# Altium project Board1.PrjPcb (part 1 of 2)
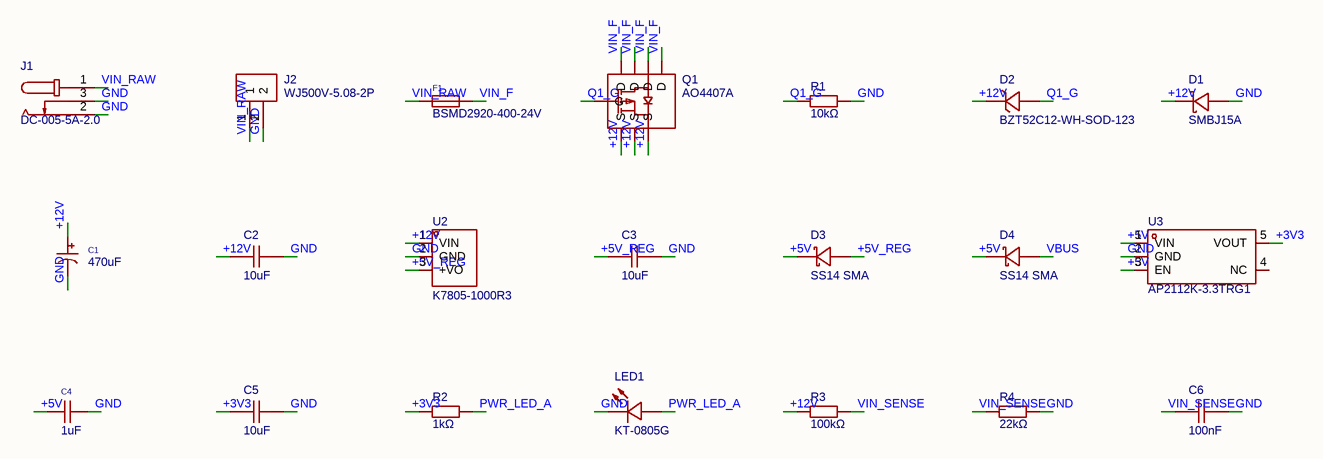
[diagram p0: 1_Power.schdoc]
5 sheets, 106 parts. Net scope: global (net labels, ports and power ports of the same name join across sheets).
Board file: PCB2.PcbDoc
Sheets:
  1_Power.schdoc
  2_MCU.schdoc
  3_Sensors.schdoc
  4_Outputs_A.schdoc
  5_Outputs_B.schdoc

## Sheet 1_Power.schdoc
size 297 x 209 mm; Symbol: Drawing-Symbol_A4; Device: Drawing-Symbol_A4; @Project Name: Irrigation Controller v2; @Page Count: 5; @Update Date: 2026-11-21; @Create Date: 2026-11-21; @Schematic Name: Schematic1; @Page No: 1; @Page Name: 1_Power; Company: EasyEDA.com; Version: V1.0; Page Size: A4; @Create Time: 17:26:39; @Update Time: 17:26:39; Border: 1; Width: 1170; Height: 825; Region Start: 1; X Region Count: 6; Y Region Count: 4; Blade Width: 10; Title Block Position: 3; @Board Name: Board1

### Parts
C1  470uF  [CAP-SMD_BD10.0-L10.3-W10.3-LS11.0-FD]
C2  10uF  [C0805]
C3  10uF  [C0805]
C4  1uF  [C0805]
C5  10uF  [C0805]
C6  100nF  [C0805]
D1  SMBJ15A  [SMB_L4.6-W3.6-LS5.3-RD]
D2  BZT52C12-WH-SOD-123  [SOD-123_L2.7-W1.7-LS3.8-RD]
D3  SS14 SMA  [SMA_L4.3-W2.6-LS5.1-RD]
D4  SS14 SMA  [SMA_L4.3-W2.6-LS5.1-RD]
F1  BSMD2920-400-24V  [F2920]
J1  DC-005-5A-2.0  [DC-IN-TH_DC-005-5A-2.0]
J2  WJ500V-5.08-2P  [CONN-TH_2P-P5.00_WJ500V-5.08-2P]
LED1  KT-0805G  [LED0805-R-RD]
Q1  AO4407A  [SOIC-8_L4.9-W3.9-P1.27-LS6.0-BL]
R1  10kΩ  [R0805]
R2  1kΩ  [R0805]
R3  100kΩ  [R0805]
R4  22kΩ  [R0805]
U2  K7805-1000R3  [PWRM-TH_K78XX-2000]
U3  AP2112K-3.3TRG1  [SOT-25-5_L2.9-W1.6-P0.95-LS2.8-BL]

### Nets
+3V3: C5.1 R2.1 U3.5(VOUT)
+5V: C4.1 D3.1(K) D4.1(K) U3.1(VIN) U3.3(EN)
+5V_REG: C3.1 D3.2(A) U2.3(+VO)
+12V: C1.1 C2.1 D1.1(K) D2.1(K) Q1.1(S) Q1.2(S) Q1.3(S) R3.1 U2.1(VIN)
GND: C1.2 C2.2 C3.2 C4.2 C5.2 C6.2 D1.2(A) J1.2 J1.3 J2.2 LED1.2(K) R1.2 R4.2 U2.2(GND) U3.2(GND)
PWR_LED_A: LED1.1(A) R2.2
Q1_G: D2.2(A) Q1.4(G) R1.1
VBUS: D4.2(A)
VIN_F: F1.2 Q1.5(D) Q1.6(D) Q1.7(D) Q1.8(D)
VIN_RAW: F1.1 J1.1 J2.1
VIN_SENSE: C6.1 R3.2 R4.1

Not connected (* = marked no-connect by the designer): U3 4(NC)

### Notes on the sheet
- Create at
- 2026-11-21
- Schematic
- Board
- Schematic1
- Board1
- Update at
- Page
- 1_Power
- Drawn
- Reviewed
- Irrigation Controller v2
- Version
- V1.0
- Size
- A4
- Page  1  Total  5
- EasyEDA.com

### Library data of the parts
C1 = RVT1E471M1010: Capacitance:470uF Tolerance:±20% Tolerance:±20% Voltage Rating:25V Ripple Current:- Equivalent Series Resistance(ESR):- Diameter:10mm Height - Seated (Max):10.2mm Lifetime:2000hrs@105℃ Operating Temperature:-55℃~+105℃ Operating Temperature:-55℃~+105℃ Pola; Manufacturer: HONOR(荣誉); Symbol: RVT1E471M1010-C3351; Add into BOM: yes; PCB Layer: Default; Tolerance: ±20%; Voltage Rating: 25V; Polarity type: Polarized; ModelId: 44cb92e87a73435bbda93569417358d9|0819f05c4eef4c71ace90d822a990e87; ModelName: CAP-SMD_BD10.0-L10.3-W10.3-H10.2; ModelTransform: 405.511,456.692,0,90,0,0,-0.004,-0.001,0; Device: RVT1E471M1010; Convert to PCB: yes; Manufacturer Part: RVT1E471M1010; Supplier: LCSC; Supplier Part: C3351; Value: 470uF; JLCPCB Part Class: Extended Part; LCSC Part Name: 470uF ±20% 25V; Supplier Footprint: SMD,D10xL10.2mm; Datasheet: https://item.szlcsc.com/datasheet/RVT1E471M1010/3742.html; Ripple Current: -; Equivalent Series Resistance(ESR): -; Diameter: 10mm; Height - Seated (Max): 10.2mm; Lifetime: 2000hrs@105℃; Operating Temperature: -55℃~+105℃; FootprintName: CAP-SMD_BD10.0-L10.3-W10.3-LS11.0-FD
C2 C3 C5 = CL21A106KAYNNNE_C15850: Capacitance:10uF Tolerance:±10% Tolerance:±10% Voltage Rating:25V Temperature Coefficient:X5R; Manufacturer: SAMSUNG(三星); Add into BOM: yes; PCB Layer: Default; Tolerance: ±10%; Voltage Rating: 25V; Temperature Coefficient: X5R; ModelId: 8c88e81f49c6409b980720ec8953afb6|0819f05c4eef4c71ace90d822a990e87; ModelName: C0805_L2.0-W1.3-H1.3; ModelTransform: 78.74,51.181,0,0,0,0,0,0.0005,0; Symbol: CL21A106KAYNNNE; Device: CL21A106KAYNNNE_C15850; Convert to PCB: yes; Manufacturer Part: CL21A106KAYNNNE; Supplier: LCSC; Supplier Part: C15850; LCSC Part Name: 10uF ±10% 25V; Supplier Footprint: 0805; JLCPCB Part Class: Basic Part; Datasheet: https://item.szlcsc.com/datasheet/CL21A106KAYNNNE/16532.html; Value: 10uF; FootprintName: C0805
C4 = CL21B105KBFNNNE: Capacitance:1uF Tolerance:±10% Tolerance:±10% Voltage Rating:50V Temperature Coefficient:X7R; Manufacturer: SAMSUNG(三星); Add into BOM: yes; PCB Layer: Default; Tolerance: ±10%; Voltage Rating: 50V; Temperature Coefficient: X7R; ModelId: 8c88e81f49c6409b980720ec8953afb6|0819f05c4eef4c71ace90d822a990e87; ModelName: C0805_L2.0-W1.3-H1.3; ModelTransform: 78.74,51.181,0,0,0,0,0,0.0005,0; Symbol: CL21B105KBFNNNE; Device: CL21B105KBFNNNE; Convert to PCB: yes; Manufacturer Part: CL21B105KBFNNNE; Supplier: LCSC; Supplier Part: C28323; Value: 1uF; JLCPCB Part Class: Basic Part; LCSC Part Name: 1uF ±10% 50V; Supplier Footprint: 0805; Datasheet: https://item.szlcsc.com/datasheet/CL21B105KBFNNNE/29074.html; FootprintName: C0805
C6 = CC0805KRX7R9BB104: Capacitance:100nF Tolerance:±10% Tolerance:±10% Voltage Rating:50V Temperature Coefficient:X7R; Manufacturer: YAGEO(国巨); Add into BOM: yes; PCB Layer: Default; Tolerance: ±10%; Voltage Rating: 50V; Temperature Coefficient: X7R; ModelId: 8c88e81f49c6409b980720ec8953afb6|0819f05c4eef4c71ace90d822a990e87; ModelName: C0805_L2.0-W1.3-H1.3; ModelTransform: 78.74,51.181,0,0,0,0,0,0.0005,0; Symbol: CC0805KRX7R9BB104; Device: CC0805KRX7R9BB104; Convert to PCB: yes; Manufacturer Part: CC0805KRX7R9BB104; Supplier: LCSC; Supplier Part: C49678; LCSC Part Name: 100nF ±10% 50V; Supplier Footprint: 0805; JLCPCB Part Class: Basic Part; Datasheet: https://item.szlcsc.com/datasheet/CC0805KRX7R9BB104/50686.html; Value: 100nF; FootprintName: C0805
D1 = SMBJ15A: Reverse Stand-Off Voltage (Vrwm):15V Maximum Clamping Voltage:24.4V Peak Pulse Current (Ipp)@10/1000us:24.6A Breakdown Voltage:16.7V; Symbol: SMBJ15A_C232769; Add into BOM: yes; PCB Layer: Default; Reverse Stand-Off Voltage (Vrwm): 15V; Maximum Clamping Voltage: 24.4V; Peak Pulse Current (Ipp)@10/1000us: 24.6A; Breakdown Voltage: 16.7V; ModelId: 6383b9be09eb4825906cf4ce91b85cee|0819f05c4eef4c71ace90d822a990e87; ModelTransform: 212.598,141.732,0,0,0,0,0,0,0; Device: SMBJ15A; Convert to PCB: yes; Manufacturer Part: SMBJ15A; Supplier: LCSC; Supplier Part: C232769; LCSC Part Name: SMBJ15A; Supplier Footprint: SMB(DO-214AA); JLCPCB Part Class: Extended Part; FootprintName: SMB_L4.6-W3.6-LS5.3-RD; ModelName: SMB_L4.6-W3.6-LS5.3-RD
D2 = BZT52C12-WH-SOD-123: Diode Configuration:1 Independent Zener Voltage(Nom):12V Reverse Leakage Current (Ir):100nA@9V Zener Voltage(Range):11.4V~12.7V Zener Voltage(Range):11.4V~12.7V Pd - Power Dissipation:500mW Impedance(Zzt):35Ω Impedance(Zzk):600Ω Operating Junction Tempera; Manufacturer: SY(顺烨); Add into BOM: yes; PCB Layer: Default; Zener Voltage(Nom): 12V; Pd - Power Dissipation: 500mW; Impedance(Zzt): 35Ω; Impedance(Zzk): 600Ω; Operating Junction Temperature Range: -55℃~+150℃; ModelId: 619603fa8f4b456cbd6047d9f8e47121|0819f05c4eef4c71ace90d822a990e87; ModelTransform: 145.669,64.961,0,0,0,0,0,0,0; Symbol: BZT52C12-WH-SOD-123; Device: BZT52C12-WH-SOD-123; Convert to PCB: yes; Manufacturer Part: BZT52C12-WH-SOD-123; Supplier: LCSC; Supplier Part: C5464725; LCSC Part Name: 独立式 耐压:12V 电流:0.1uA@9V; Supplier Footprint: SOD-123; JLCPCB Part Class: Extended Part; Datasheet: https://item.szlcsc.com/datasheet/BZT52C12-WH-SOD-123/6380071.html; Diode Configuration: 1 Independent; Reverse Leakage Current (Ir): 100nA@9V; Zener Voltage(Range): 11.4V~12.7V; Tolerance: -; FootprintName: SOD-123_L2.7-W1.7-LS3.8-RD; ModelName: SOD-123_L2.7-W1.7-LS3.8-RD
D3 D4 = SS14 SMA: Diode Configuration:1 Independent Voltage - Forward(Vf@If):550mV@1A Voltage - DC Reverse(Vr):40V Current - Rectified:1A Reverse Leakage Current (Ir):500uA@40V Operating Junction Temperature Range:-65℃~+125℃ Operating Junction Temperature Range:-65℃~+125℃; Manufacturer: Yint(音特电子); Add into BOM: yes; PCB Layer: Default; Voltage - DC Reverse(Vr): 40V; Current - Rectified: 1A; Non-Repetitive Peak Forward Surge Current: 40A; ModelId: 9f0f28a3f5e244ceb50a0213b7a9858d|0819f05c4eef4c71ace90d822a990e87; ModelTransform: 196.4563,102.362,0,0,0,0,0.001,-0.001,0; Symbol: SS14 SMA; Device: SS14 SMA; Convert to PCB: yes; Manufacturer Part: SS14 SMA; Supplier: LCSC; Supplier Part: C2920036; LCSC Part Name: 电压:40V 电流:1A; Supplier Footprint: SMA(DO-214AC); JLCPCB Part Class: Extended Part; Datasheet: https://item.szlcsc.com/datasheet/SS14%2520SMA/3223905.html; Diode Configuration: 1 Independent; Voltage - Forward(Vf@If): 550mV@1A; Reverse Leakage Current (Ir): 500uA@40V; Operating Junction Temperature Range: -65℃~+125℃; FootprintName: SMA_L4.3-W2.6-LS5.1-RD; ModelName: SMA_L4.3-W2.6-LS5.1-RD
F1 = BSMD2920-400-24V: Voltage - Max:24V Current - Max:40A Hold Current:4A Trip Current:8A Power Dissipation:2W Resistance - Initial (Ri) (Min):8mΩ Resistance - Post Trip (R1) (Max):40mΩ Time to Trip(Max):4s Operating Temperature:-40℃~+85℃ Operating Temperature:-40℃~+85℃ Length; Manufacturer: BHFUSE(佰宏); Add into BOM: yes; PCB Layer: Default; Voltage - Max: 24V; Current - Max: 40A; Hold Current: 4A; Trip Current: 8A; Power Dissipation: 2W; Resistance - Initial (Ri) (Min): 8mΩ; Resistance - Post Trip (R1) (Max): 40mΩ; Time to Trip(Max): 4s; ModelId: c20979b6eed84fe694c25fdbe1326c05|0819f05c4eef4c71ace90d822a990e87; ModelName: F2920-1; ModelTransform: 289.7632,201.5744,0,0,0,0,0,0,0; Symbol: BSMD2920-400-24V; Device: BSMD2920-400-24V; Convert to PCB: yes; Manufacturer Part: BSMD2920-400-24V; Supplier: LCSC; Supplier Part: C960036; JLCPCB Part Class: Extended Part; LCSC Part Name: 24V 4A 2920自恢复; Supplier Footprint: 2920; Datasheet: https://item.szlcsc.com/datasheet/BSMD2920-400-24V/1039136.html; Operating Temperature: -40℃~+85℃; Length: 7.98mm; Width: 5.44mm; Height: 1.6mm; Pitch: -; FootprintName: F2920
J1 = DC-005-5A-2.0: Connector Type:DC Power Jack Mounting Type:Right Angle Inside Contact Diameter:2mm Outside Contact Diameter:6.2mm Current Rating:5A Voltage Rating (Max):24V Body Height:11mm Length:14mm Width:9mm Operating Temperature:-20℃~+70℃ Operating Temperature:-20℃~; Manufacturer: XKB Connection(中国星坤); Add into BOM: yes; PCB Layer: Default; Inside Contact Diameter: 2mm; Outside Contact Diameter: 6.2mm; Current Rating: 5A; Voltage Rating (Max): 24V; Body Height: 11mm; ModelId: 141bb14832c5420aa468d11a1b22105a|0819f05c4eef4c71ace90d822a990e87; ModelName: DC-IN-TH_L14.4-W9.0-H11.0; ModelTransform: 366.141,566.928,0,270,0,0,-143.701,86.614,-157.48; Symbol: DC-005-5A-2.0; Device: DC-005-5A-2.0; Convert to PCB: yes; Manufacturer Part: DC-005-5A-2.0; Supplier: LCSC; Supplier Part: C381116; LCSC Part Name: DC电源插座 内径:2mm 外径:6.2mm; Supplier Footprint: 插件; JLCPCB Part Class: Extended Part; Datasheet: https://item.szlcsc.com/datasheet/DC-005-5A-2.0/353348.html; Connector Type: DC Power Jack; Mounting Type: Right Angle; Length: 14mm; Width: 9mm; Operating Temperature: -20℃~+70℃; FootprintName: DC-IN-TH_DC-005-5A-2.0
J2 = WJ500V-5.08-2P: Number of Positions or Pins:1x2P Pitch:5.08mm Color:Green Mounting Type:Through Hole Number of Pins:2P Number of Rows:1 Number of PINs Per Row:2 Screw Specification:M2.5 Current Rating:18A Voltage Rating (Max):250V Wire Gauge - AWG:14~30 Wire Gauge - mm2:; Manufacturer: KANGNEX(康奈克斯电气); Symbol: WJ500V-5.08-2P-14-00A; Add into BOM: yes; PCB Layer: Default; Number of Positions or Pins: 1x2P; Pitch: 5.08mm; Number of PINs Per Row: 2; Screw Specification: M2.5; Current Rating: 18A; Voltage Rating (Max): 250V; Wire Gauge - AWG: 14~30; Wire Gauge - mm2: 2.5; ModelId: 2bff34d19d2f4f9cb7f6a8b7d3be06fd|0819f05c4eef4c71ace90d822a990e87; ModelTransform: 423.621,393.7,0,0,0,0,-11.811,19.685,-137.795; Device: WJ500V-5.08-2P; Convert to PCB: yes; Manufacturer Part: WJ500V-5.08-2P; Supplier: LCSC; Supplier Part: C8465; LCSC Part Name: 1x2P 5.08mm 直插 排数:1 每排P数:2; Supplier Footprint: 插件,P=5.08mm; JLCPCB Part Class: Extended Part; Datasheet: https://item.szlcsc.com/datasheet/WJ500V-5.08-2P/8959.html; Color: Green; Mounting Type: Through Hole; Number of Pins: 2P; Number of Rows: 1; Operating Temperature: -40℃~+105℃; Height Above Board: 14.07mm; FootprintName: CONN-TH_2P-P5.00_WJ500V-5.08-2P; ModelName: CONN-TH_2P-P5.00_WJ500V-5.08-2P
LED1 = KT-0805G: Lamp Holder Type:2mm x 1.25mm square LED Illumination Color:Emerald Green Voltage - Forward(Vf):2.6V~3.1V Voltage - Forward(Vf):2.6V~3.1V Power(Watts):100mW Forward Current:5mA Wavelength - Dominant:513nm~528nm Wavelength - Dominant:513nm~528nm Peak Wavel; Manufacturer: KENTO; Symbol: 0805G (Green); Add into BOM: yes; PCB Layer: Default; Power(Watts): 100mW; Forward Current: 5mA; Peak Wavelength: 525nm; Diode Configuration: Discrete Diode; Lens Color: Water Clear; Luminous Intensity: 430mcd; Viewing Angle: 120°; ModelId: 167045bb0eae412b9d5564860e113a91|0819f05c4eef4c71ace90d822a990e87; ModelName: LED0805-RD; ModelTransform: 79.527,49.2125,0,0,0,0,0,0,0; Device: KT-0805G; Convert to PCB: yes; Manufacturer Part: KT-0805G; Supplier: LCSC; Supplier Part: C2297; LCSC Part Name: 0805 翠绿 高亮; Supplier Footprint: 0805; JLCPCB Part Class: Basic Part; Datasheet: https://item.szlcsc.com/datasheet/KT-0805G/2670.html; Lamp Holder Type: 2mm x 1.25mm square LED; Illumination Color: Emerald Green; Voltage - Forward(Vf): 2.6V~3.1V; Wavelength - Dominant: 513nm~528nm; Color Temperature: -; Mounting Style: -; Operating Temperature: -40℃~+85℃; FootprintName: LED0805-R-RD
Q1 = AO4407A_C16072: Number:1 P-Channel Drain to Source Voltage:30V Current - Continuous Drain(Id):12A RDS(on):38mΩ@5V Pd - Power Dissipation:3.1W Gate Threshold Voltage (Vgs(th)):3V Gate Charge(Qg):39nC@10V Input Capacitance(Ciss):2.6nF Reverse Transfer Capacitance (Crss@Vds; Manufacturer: AOS; Add into BOM: yes; PCB Layer: Default; Drain to Source Voltage: 30V; Current - Continuous Drain(Id): 12A; Pd - Power Dissipation: 3.1W; Gate Threshold Voltage (Vgs(th)): 3V; Input Capacitance(Ciss): 2.6nF; Reverse Transfer Capacitance (Crss@Vds): 295pF; Output Capacitance(Coss): 370pF; Vgs: ±25V; ModelId: 2ec1ac1bf9bf4d09a988fcee15e6a02d|0819f05c4eef4c71ace90d822a990e87; ModelName: SOIC-8_L4.9-W3.9-H1.7-LS6.0-P1.27; ModelTransform: 192.913,236.22,0,0,0,0,0,0,0; Symbol: AO4407A; Device: AO4407A_C16072; Convert to PCB: yes; Manufacturer Part: AO4407A; Supplier: LCSC; Supplier Part: C16072; LCSC Part Name: 1个P沟道 耐压:30V 电流:12A; Supplier Footprint: SOIC-8; JLCPCB Part Class: Extended Part; Datasheet: https://item.szlcsc.com/datasheet/AO4407A/16754.html; Number: 1 P-Channel; RDS(on): 38mΩ@5V; Gate Charge(Qg): 39nC@10V; Operating Temperature: -; Configuration: -; Type: P-Channel; FootprintName: SOIC-8_L4.9-W3.9-P1.27-LS6.0-BL
R1 = 0805W8F1002T5E: Type:Thick Film Resistor Resistance:10kΩ Tolerance:±1% Tolerance:±1% Power(Watts):125mW Voltage-Supply(Max):150V Temperature Coefficient:±100ppm/℃ Temperature Coefficient:±100ppm/℃ Operating Temperature:-55℃~+155℃ Operating Temperature:-55℃~+155℃; Manufacturer: UNI-ROYAL(厚声); Add into BOM: yes; PCB Layer: Default; Tolerance: ±1%; Power(Watts): 125mW; Voltage-Supply(Max): 150V; ModelId: b83c7c5430874b8eb2319a65d9433429|0819f05c4eef4c71ace90d822a990e87; ModelName: R0805_L2.0-W1.3-H0.6; ModelTransform: 78.74,51.181,0,0,0,0,0,-0.0005,0; Symbol: 0805W8F1002T5E; Device: 0805W8F1002T5E; Convert to PCB: yes; Manufacturer Part: 0805W8F1002T5E; Supplier: LCSC; Supplier Part: C17414; LCSC Part Name: 厚膜电阻 10kΩ ±1%; Supplier Footprint: 0805; JLCPCB Part Class: Basic Part; Datasheet: https://item.szlcsc.com/datasheet/0805W8F1002T5E/18102.html; Type: Thick Film Resistor; Value: 10kΩ; Temperature Coefficient: ±100ppm/℃; Operating Temperature: -55℃~+155℃; FootprintName: R0805
R2 = 0805W8F1001T5E: Type:Thick Film Resistors Resistance:1kΩ Tolerance:±1% Tolerance:±1% Power(Watts): Overload Voltage (Max): Temperature Coefficient:±100ppm/℃ Temperature Coefficient:±100ppm/℃ Operating Temperature Range:-55℃~+155℃ Operating Temperature Range:-55℃~+155℃; Manufacturer: UNI-ROYAL(厚声); Add into BOM: yes; PCB Layer: Default; Tolerance: ±1%; ModelId: b83c7c5430874b8eb2319a65d9433429|0819f05c4eef4c71ace90d822a990e87; ModelName: R0805_L2.0-W1.3-H0.6; ModelTransform: 78.74,51.181,0,0,0,0,0,-0.0005,0; Symbol: 0805W8F1001T5E; Device: 0805W8F1001T5E; Convert to PCB: yes; Manufacturer Part: 0805W8F1001T5E; Supplier: LCSC; Supplier Part: C17513; LCSC Part Name: 1kΩ ±1% 125mW 厚膜电阻; Supplier Footprint: 0805; JLCPCB Part Class: Basic Part; Datasheet: https://atta.szlcsc.com/upload/public/pdf/source/20200306/C422600_1E6D84923E4A46A82E41ADD87F860B5C.pdf; Type: Thick Film Resistors; Value: 1kΩ; Temperature Coefficient: ±100ppm/℃; Operating Temperature Range: -55℃~+155℃; FootprintName: R0805
R3 = 0805W8F1003T5E (SMT业务专用): Type: Resistance: Tolerance:±1% Tolerance:±1% Power(Watts):- Overload Voltage (Max):-; Manufacturer: UNI-ROYAL(厚声); Add into BOM: yes; PCB Layer: Default; Tolerance: ±1%; ModelId: b83c7c5430874b8eb2319a65d9433429|0819f05c4eef4c71ace90d822a990e87; ModelName: R0805_L2.0-W1.3-H0.6; ModelTransform: 78.74,51.181,0,0,0,0,0,-0.0005,0; Symbol: 0805W8F1003T5E; Device: 0805W8F1003T5E (SMT业务专用); Convert to PCB: yes; Manufacturer Part: 0805W8F1003T5E (SMT业务专用); Supplier: LCSC; Supplier Part: C17407; LCSC Part Name: 100kΩ ±1%; Supplier Footprint: 0805; JLCPCB Part Class: Extended Part; Datasheet: https://atta.szlcsc.com/upload/public/pdf/source/20200102/C423413_58AC64FF5730584578C10BF0002471B1.pdf; Value: 100kΩ; Power(Watts): -; Overload Voltage (Max): -; FootprintName: R0805
R4 = 0805W8F2202T5E: Type:Thick Film Resistor Resistance:22kΩ Tolerance:±1% Tolerance:±1% Power(Watts):125mW Voltage-Supply(Max):150V Temperature Coefficient:±100ppm/℃ Temperature Coefficient:±100ppm/℃ Operating Temperature:-55℃~+155℃ Operating Temperature:-55℃~+155℃; Manufacturer: UNI-ROYAL(厚声); Add into BOM: yes; PCB Layer: Default; Tolerance: ±1%; Power(Watts): 125mW; Voltage-Supply(Max): 150V; ModelId: b83c7c5430874b8eb2319a65d9433429|0819f05c4eef4c71ace90d822a990e87; ModelName: R0805_L2.0-W1.3-H0.6; ModelTransform: 78.74,51.181,0,0,0,0,0,-0.0005,0; Symbol: 0805W8F2202T5E; Device: 0805W8F2202T5E; Convert to PCB: yes; Manufacturer Part: 0805W8F2202T5E; Supplier: LCSC; Supplier Part: C17560; LCSC Part Name: 厚膜电阻 22kΩ ±1%; Supplier Footprint: 0805; JLCPCB Part Class: Basic Part; Datasheet: https://item.szlcsc.com/datasheet/0805W8F2202T5E/18248.html; Type: Thick Film Resistor; Value: 22kΩ; Temperature Coefficient: ±100ppm/℃; Operating Temperature: -55℃~+155℃; FootprintName: R0805
U2 = K7805-1000R3_C111280: Type:- Function:- Number of Outputs:1 Voltage - Supply:8V~36V Voltage - Supply:8V~36V Conversion Efficiency:86%；93% Conversion Efficiency:86%；93% Output Voltage:-5V；5V Output Voltage:-5V；5V Output Voltage Accuracy:±3% Output Voltage Accuracy:±3% Output Cu; Manufacturer: MORNSUN(金升阳); Add into BOM: yes; PCB Layer: Default; Number of Outputs: 1; Voltage - Supply: 8V~36V; Output Voltage: -5V；5V; Output Voltage Accuracy: ±3%; Output Current(Max): 1A；-500mA; Quiescent Supply Current: 100uA; Ripple Noise: 75mVp-p; Switching Frequency: 520kHz; Capacitive Load(Max): 680uF；330uF; ModelId: 655201e880d449c5a288a7368650974c|0819f05c4eef4c71ace90d822a990e87; ModelName: PWRM-TH_L11.5-W9.0-H17.5-P2.54; ModelTransform: 452.755,354.33,0,0,0,0,0.512,-92.48,-137.795; Symbol: K7805-1000R3; Device: K7805-1000R3_C111280; Convert to PCB: yes; Manufacturer Part: K7805-1000R3; Supplier: LCSC; Supplier Part: C111280; LCSC Part Name: DC/DC模块电源，宽电压输入，非隔离稳压单路输出; Supplier Footprint: SIP,11.5x9mm; JLCPCB Part Class: Extended Part; Datasheet: https://item.szlcsc.com/datasheet/K7805-1000R3/112506.html; Type: -; Function: -; Conversion Efficiency: 86%；93%; Operating Temperature Range: -40℃~+85℃; Length: 11.5mm; Width: 9mm; Height: 17.5mm; Features: Short Circuit Protection；Automatic fault recovery; FootprintName: PWRM-TH_K78XX-2000
U3 = AP2112K-3.3TRG1: Output Configuration:Positive Voltage - Supply:6V Output Voltage:3.3V Output Voltage:3.3V Output Current:600mA Power Supply Rejection Ratio (PSRR):65dB@(1kHz) Voltage Dropout:250mV@(600mA) standby current:55uA Noise:50uVrms Features:Enable control；Short C; Manufacturer: DIODES(美台); Add into BOM: yes; PCB Layer: Default; Voltage - Supply: 6V; Output Voltage: 3.3V; standby current: 55uA; Output Type: Fixed; Number of Outputs: 1; ModelId: 6177bbcd6fc94df4b4ba2f22405723a0|0819f05c4eef4c71ace90d822a990e87; ModelTransform: 114.173,110.236,0,0,0,0,0,0,0; Symbol: AP2112K-3.3TRG1; Device: AP2112K-3.3TRG1; Convert to PCB: yes; Manufacturer Part: AP2112K-3.3TRG1; Supplier: LCSC; Supplier Part: C51118; LCSC Part Name: 3.3V 600mA 6V; Supplier Footprint: SOT-25-5; JLCPCB Part Class: Extended Part; Datasheet: https://item.szlcsc.com/datasheet/AP2112K-3.3TRG1/52131.html; Output Configuration: Positive; Output Current: 600mA; Power Supply Rejection Ratio (PSRR): 65dB@(1kHz); Voltage Dropout: 250mV@(600mA); Noise: 50uVrms; Features: Enable control；Short Circuit Protection；Output discharge；Over Current Protection；Thermal shutdown; Operating Temperature: -40℃~+85℃@(Ta); FootprintName: SOT-25-5_L2.9-W1.6-P0.95-LS2.8-BL; ModelName: SOT-25-5_L2.9-W1.6-P0.95-LS2.8-BL

## Sheet 2_MCU.schdoc
size 297 x 209 mm; Symbol: Drawing-Symbol_A4; Device: Drawing-Symbol_A4; @Project Name: Irrigation Controller v2; @Page Count: 5; @Update Date: 2026-11-21; @Create Date: 2026-11-21; @Schematic Name: Schematic1; @Page No: 2; @Page Name: 2_MCU; Company: EasyEDA.com; Version: V1.0; Page Size: A4; @Create Time: 17:28:43; @Update Time: 17:28:43; Border: 1; Width: 1170; Height: 825; Region Start: 1; X Region Count: 6; Y Region Count: 4; Blade Width: 10; Title Block Position: 3; @Board Name: Board1
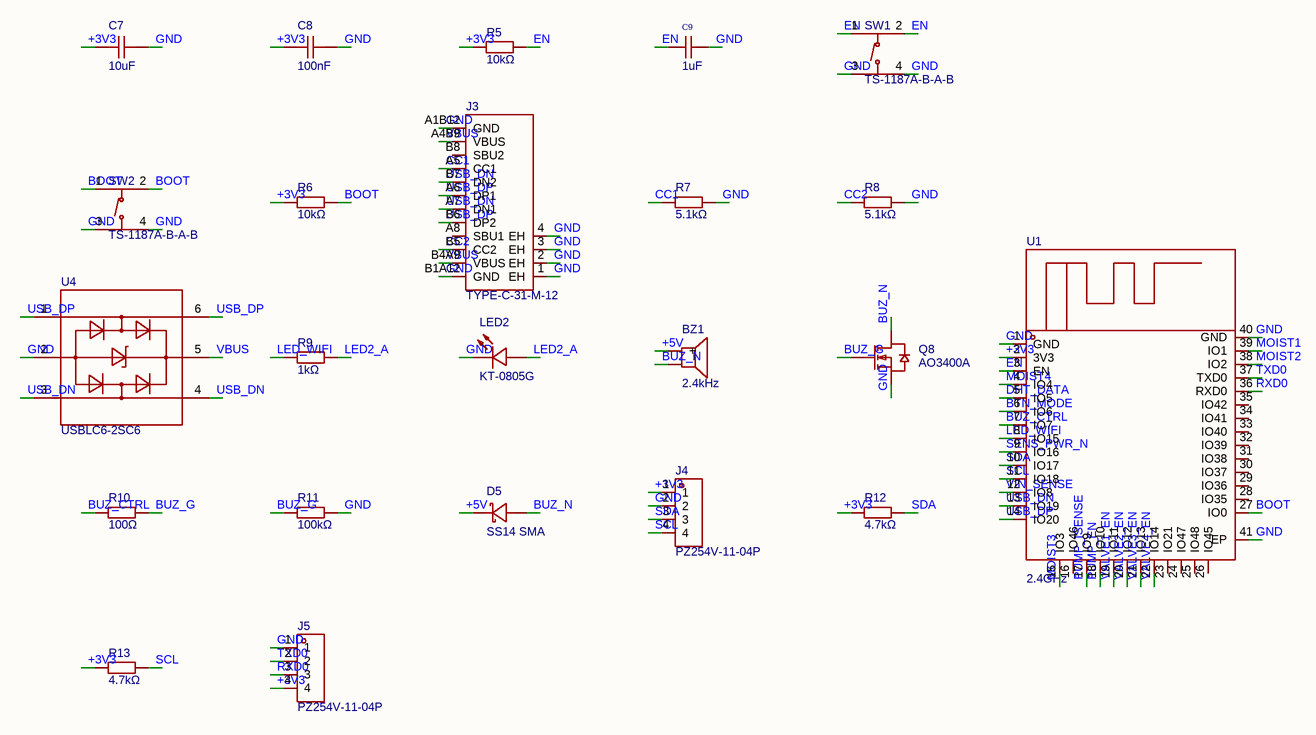
[diagram p1: 2_MCU.schdoc]

### Parts
BZ1  2.4kHz  [BUZ-TH_BD12.0-P7.60-D0.6-FD]
C7  10uF  [C0805]
C8  100nF  [C0805]
C9  1uF  [C0805]
D5  SS14 SMA  [SMA_L4.3-W2.6-LS5.1-RD]
J3  TYPE-C-31-M-12  [USB-C_SMD-TYPE-C-31-M-12_1]
J4  PZ254V-11-04P  [HDR-TH_4P-P2.54-V-M]
J5  PZ254V-11-04P  [HDR-TH_4P-P2.54-V-M]
LED2  KT-0805G  [LED0805-R-RD]
Q8  AO3400A  [SOT-23-3_L2.9-W1.3-P1.90-LS2.4-BR]
R5  10kΩ  [R0805]
R6  10kΩ  [R0805]
R7  5.1kΩ  [R0805]
R8  5.1kΩ  [R0805]
R9  1kΩ  [R0805]
R10  100Ω  [R0805]
R11  100kΩ  [R0805]
R12  4.7kΩ  [R0805]
R13  4.7kΩ  [R0805]
SW1  TS-1187A-B-A-B  [SW-SMD_4P-L5.1-W5.1-P3.70-LS6.5-TL_H1.5]
SW2  TS-1187A-B-A-B  [SW-SMD_4P-L5.1-W5.1-P3.70-LS6.5-TL_H1.5]
U1  2.4GHz  [WIFIM-SMD_ESP32-S3-WROOM-1-N8]
U4  USBLC6-2SC6  [SOT-23-6_L2.9-W1.6-P0.95-LS2.8-BL]

### Nets
+3V3: C7.1 C8.1 J4.1 J5.4 R5.1 R6.1 R12.1 R13.1 U1.2(3V3)
+5V: BZ1.1(+) D5.1(K)
BOOT: R6.2 SW2.1(A) SW2.2(B) U1.27(IO0)
BTN_MODE: U1.6(IO6)
BUZ_CTRL: R10.1 U1.7(IO7)
BUZ_G: Q8.1(G) R10.2 R11.1
BUZ_N: BZ1.2 D5.2(A) Q8.3(D)
CC1: J3.A5(CC1) R7.1
CC2: J3.B5(CC2) R8.1
DHT_DATA: U1.5(IO5)
EN: C9.1 R5.2 SW1.1(A) SW1.2(B) U1.3(EN)
GND: C7.2 C8.2 C9.2 J3.1(EH) J3.2(EH) J3.3(EH) J3.4(EH) J3.A1B12(GND) J3.B1A12(GND) J4.2 J5.1 LED2.2(K) Q8.2(S) R7.2 R8.2 R11.2 SW1.3(C) SW1.4(D) SW2.3(C) SW2.4(D) U1.1(GND) U1.40(GND) U1.41(EP) U4.2
LED2_A: LED2.1(A) R9.2
LED_WIFI: R9.1 U1.8(IO15)
MOIST1: U1.39(IO1)
MOIST2: U1.38(IO2)
MOIST3: U1.15(IO3)
MOIST4: U1.4(IO4)
PUMP_EN: U1.18(IO10)
PUMP_ISENSE: U1.17(IO9)
RXD0: J5.3 U1.36(RXD0)
SCL: J4.4 R13.2 U1.11(IO18)
SDA: J4.3 R12.2 U1.10(IO17)
SENS_PWR_N: U1.9(IO16)
TXD0: J5.2 U1.37(TXD0)
USB_DN: J3.A7(DN1) J3.B7(DN2) U1.13(IO19) U4.3 U4.4
USB_DP: J3.A6(DP1) J3.B6(DP2) U1.14(IO20) U4.1 U4.6
VALVE1_EN: U1.19(IO11)
VALVE2_EN: U1.20(IO12)
VALVE3_EN: U1.21(IO13)
VALVE4_EN: U1.22(IO14)
VBUS: J3.A4B9(VBUS) J3.B4A9(VBUS) U4.5
VIN_SENSE: U1.12(IO8)

Not connected (* = marked no-connect by the designer): J3 A8(SBU1) B8(SBU2); U1 16(IO46) 23(IO21) 24(IO47) 25(IO48) 26(IO45) 28(IO35) 29(IO36) 30(IO37) 31(IO38) 32(IO39) 33(IO40) 34(IO41) 35(IO42)

### Notes on the sheet
- Create at
- 2026-11-21
- Schematic
- Board
- Schematic1
- Board1
- Update at
- Page
- 2_MCU
- Drawn
- Reviewed
- Irrigation Controller v2
- Version
- V1.0
- Size
- A4
- Page  2  Total  5
- EasyEDA.com

### Library data of the parts
BZ1 = TMB12A05: Driver Circuitry:Active Buzzer (Built-in Driving Circuit) Technology:Electromagnetic Voltage Rating:5V Voltage - Supply:4V~8V Voltage - Supply:4V~8V Frequency:2.4kHz Current Consumption:30mA Sound Pressure Level(SPL):85dB Diameter(φD):12mm Length:- Width:; Manufacturer: 华能; Add into BOM: yes; PCB Layer: Default; Voltage Rating: 5V; Voltage - Supply: 4V~8V; Current Consumption: 30mA; Sound Pressure Level(SPL): 85dB; ModelId: 309f522c52df4298a8617da4d1b9f47c|0819f05c4eef4c71ace90d822a990e87; ModelName: BUZ-TH_D12.0-H9.5-P7.60; ModelTransform: 472.44,472.176,0,90,0,0,-0.787,0,-177.165; Symbol: TMB12A05; Device: TMB12A05; Convert to PCB: yes; Manufacturer Part: TMB12A05; Supplier: LCSC; Supplier Part: C96093; LCSC Part Name: 有源(内含驱动线路) 电磁式 2.4kHz; Supplier Footprint: 插件,D=12mm; JLCPCB Part Class: Extended Part; Datasheet: https://item.szlcsc.com/datasheet/TMB12A05/97297.html; Driver Circuitry: Active Buzzer (Built-in Driving Circuit); Technology: Electromagnetic; Value: 2.4kHz; Diameter(φD): 12mm; Length: -; Width: -; Height: 9.8mm; Operating Temperature: -40℃~+85℃; Mounting Type: Through-hole; Lead Pitch: -; Continuous Operating Time: -; FootprintName: BUZ-TH_BD12.0-P7.60-D0.6-FD
C7 = CL21A106KAYNNNE_C15850: as C2 on sheet 1_Power; Symbol: CL21A106KAYNNNE; Device: CL21A106KAYNNNE_C15850; Convert to PCB: yes; Manufacturer Part: CL21A106KAYNNNE; Supplier: LCSC; Supplier Part: C15850; LCSC Part Name: 10uF ±10% 25V; Supplier Footprint: 0805; JLCPCB Part Class: Basic Part; Datasheet: https://item.szlcsc.com/datasheet/CL21A106KAYNNNE/16532.html; Value: 10uF; FootprintName: C0805
C8 = CC0805KRX7R9BB104: as C6 on sheet 1_Power; Symbol: CC0805KRX7R9BB104; Device: CC0805KRX7R9BB104; Convert to PCB: yes; Manufacturer Part: CC0805KRX7R9BB104; Supplier: LCSC; Supplier Part: C49678; LCSC Part Name: 100nF ±10% 50V; Supplier Footprint: 0805; JLCPCB Part Class: Basic Part; Datasheet: https://item.szlcsc.com/datasheet/CC0805KRX7R9BB104/50686.html; Value: 100nF; FootprintName: C0805
C9 = CL21B105KBFNNNE: as C4 on sheet 1_Power; Symbol: CL21B105KBFNNNE; Device: CL21B105KBFNNNE; Convert to PCB: yes; Manufacturer Part: CL21B105KBFNNNE; Supplier: LCSC; Supplier Part: C28323; Value: 1uF; JLCPCB Part Class: Basic Part; LCSC Part Name: 1uF ±10% 50V; Supplier Footprint: 0805; Datasheet: https://item.szlcsc.com/datasheet/CL21B105KBFNNNE/29074.html; FootprintName: C0805
D5 = SS14 SMA: as D3 on sheet 1_Power; Symbol: SS14 SMA; Device: SS14 SMA; Convert to PCB: yes; Manufacturer Part: SS14 SMA; Supplier: LCSC; Supplier Part: C2920036; LCSC Part Name: 电压:40V 电流:1A; Supplier Footprint: SMA(DO-214AC); JLCPCB Part Class: Extended Part; Datasheet: https://item.szlcsc.com/datasheet/SS14%2520SMA/3223905.html; Diode Configuration: 1 Independent; Voltage - Forward(Vf@If): 550mV@1A; Reverse Leakage Current (Ir): 500uA@40V; Operating Junction Temperature Range: -65℃~+125℃; FootprintName: SMA_L4.3-W2.6-LS5.1-RD; ModelName: SMA_L4.3-W2.6-LS5.1-RD
J3 = TYPE-C-31-M-12: Connector Type:Type-C Protocol Standard:- Gender:Female Mounting Type:Surface Mount, Right Angle Number of Contacts:16P Number of Ports:1 Current Rating-Power:5A Voltage Rating:20V Connect-Disconnect Life:10,000 cycles Length:7.35mm Operating Temperature:; Manufacturer: 韩国韩荣; Add into BOM: yes; PCB Layer: Default; Connector Type: Type-C; Gender: Female; Number of Contacts: 16P; Number of Ports: 1; Current Rating-Power: 5A; Voltage Rating: 20V; ModelId: 8421221a464047838322348b3a9debc3|0819f05c4eef4c71ace90d822a990e87; ModelTransform: 351.9678,311.023,0,180,0,0,0,-43.307,-33.465; Symbol: TYPE-C-31-M-12; Device: TYPE-C-31-M-12; Convert to PCB: yes; Manufacturer Part: TYPE-C-31-M-12; Supplier: LCSC; Supplier Part: C165948; LCSC Part Name: Type-C 母 卧贴; Supplier Footprint: SMD; JLCPCB Part Class: Extended Part; Datasheet: https://item.szlcsc.com/datasheet/TYPE-C-31-M-12/177331.html; Protocol Standard: -; Mounting Type: Surface Mount, Right Angle; Connect-Disconnect Life: 10,000 cycles; Length: 7.35mm; Operating Temperature: -30℃~+80℃; FootprintName: USB-C_SMD-TYPE-C-31-M-12_1; ModelName: USB-C_SMD-TYPE-C-31-M-12_1
J4 J5 = PZ254V-11-04P_C492403: Pin Structure:1x4P Pitch:2.54mm Row Spacing:- Circluar Pins/Square Pins:Square pin Mounting Type:Through Hole Number of Rows:1 Number of Pins:4P Current Rating:3A Voltage Rating (Max):250V Length of Mating Pin:6.1mm Insulation Height:2.5mm Length of End C; Manufacturer: XFCN(兴飞); Add into BOM: yes; PCB Layer: Default; Pin Structure: 1x4P; Pitch: 2.54mm; Current Rating: 3A; Voltage Rating (Max): 250V; ModelId: 69e0934d9b9245f6ab499bc5a319b3aa|0819f05c4eef4c71ace90d822a990e87; ModelName: HDR-TH_4P-P2.54-M-LI-1X4P; ModelTransform: 399.999,104.7242,0,0,0,0,0,0,-118.11; Symbol: PZ254V-11-04P; Device: PZ254V-11-04P_C492403; Convert to PCB: yes; Manufacturer Part: PZ254V-11-04P; Supplier: LCSC; Supplier Part: C492403; LCSC Part Name: 1x4P 间距:2.54mm 方针 直插; Supplier Footprint: 插件,P=2.54mm; JLCPCB Part Class: Extended Part; Datasheet: https://item.szlcsc.com/datasheet/PZ254V-11-04P/502959.html; Row Spacing: -; Circluar Pins/Square Pins: Square pin; Mounting Type: Through Hole; Number of Rows: 1; Number of Pins: 4P; Length of Mating Pin: 6.1mm; Insulation Height: 2.5mm; Length of End Connection Pin: 3mm; Contact Material: Brass; Contact Plating: Gold; Operating Temperature: -40℃~+105℃; Color: Black; FootprintName: HDR-TH_4P-P2.54-V-M
LED2 = KT-0805G: as LED1 on sheet 1_Power; Device: KT-0805G; Convert to PCB: yes; Manufacturer Part: KT-0805G; Supplier: LCSC; Supplier Part: C2297; LCSC Part Name: 0805 翠绿 高亮; Supplier Footprint: 0805; JLCPCB Part Class: Basic Part; Datasheet: https://item.szlcsc.com/datasheet/KT-0805G/2670.html; Lamp Holder Type: 2mm x 1.25mm square LED; Illumination Color: Emerald Green; Voltage - Forward(Vf): 2.6V~3.1V; Wavelength - Dominant: 513nm~528nm; Color Temperature: -; Mounting Style: -; Operating Temperature: -40℃~+85℃; FootprintName: LED0805-R-RD
Q8 = AO3400A_C20917: Number:1 N-channel Drain to Source Voltage:30V Current - Continuous Drain(Id):5.7A RDS(on):48mΩ@2.5V Pd - Power Dissipation:1.4W Gate Threshold Voltage (Vgs(th)):1.45V Gate Charge(Qg):7nC@10V Input Capacitance(Ciss):630pF Reverse Transfer Capacitance (Crs; Manufacturer: AOS; Add into BOM: yes; PCB Layer: Default; Drain to Source Voltage: 30V; Current - Continuous Drain(Id): 5.7A; Pd - Power Dissipation: 1.4W; Gate Threshold Voltage (Vgs(th)): 1.45V; Input Capacitance(Ciss): 630pF; Reverse Transfer Capacitance (Crss@Vds): 50pF; Output Capacitance(Coss): 75pF; Vgs: ±12V; ModelId: 62a57c6760504a01965db6419a6d07df|0819f05c4eef4c71ace90d822a990e87; ModelName: SOT-23-3P_L2.9-W1.3-H1.0-LS2.4-P0.95; ModelTransform: 98.425,114.173,0,180,0,0,0.0005,-0.0005,0; Symbol: AO3400A; Device: AO3400A_C20917; Convert to PCB: yes; Manufacturer Part: AO3400A; Supplier: LCSC; Supplier Part: C20917; LCSC Part Name: N沟道 耐压:30V; Supplier Footprint: SOT-23; JLCPCB Part Class: Basic Part; Datasheet: https://item.szlcsc.com/datasheet/AO3400A/21629.html; Number: 1 N-channel; RDS(on): 48mΩ@2.5V; Gate Charge(Qg): 7nC@10V; Operating Temperature: -55℃~+150℃; Configuration: -; Type: N-Channel; FootprintName: SOT-23-3_L2.9-W1.3-P1.90-LS2.4-BR
R5 R6 = 0805W8F1002T5E: as R1 on sheet 1_Power; Symbol: 0805W8F1002T5E; Device: 0805W8F1002T5E; Convert to PCB: yes; Manufacturer Part: 0805W8F1002T5E; Supplier: LCSC; Supplier Part: C17414; LCSC Part Name: 厚膜电阻 10kΩ ±1%; Supplier Footprint: 0805; JLCPCB Part Class: Basic Part; Datasheet: https://item.szlcsc.com/datasheet/0805W8F1002T5E/18102.html; Type: Thick Film Resistor; Value: 10kΩ; Temperature Coefficient: ±100ppm/℃; Operating Temperature: -55℃~+155℃; FootprintName: R0805
R7 R8 = 0805W8F5101T5E: Type:Thick Film Resistor Resistance:5.1kΩ Tolerance:±1% Tolerance:±1% Power(Watts):125mW Voltage-Supply(Max):150V Temperature Coefficient:±100ppm/℃ Temperature Coefficient:±100ppm/℃ Operating Temperature:-55℃~+155℃ Operating Temperature:-55℃~+155℃; Manufacturer: UNI-ROYAL(厚声); Add into BOM: yes; PCB Layer: Default; Tolerance: ±1%; Power(Watts): 125mW; Voltage-Supply(Max): 150V; ModelId: b83c7c5430874b8eb2319a65d9433429|0819f05c4eef4c71ace90d822a990e87; ModelName: R0805_L2.0-W1.3-H0.6; ModelTransform: 78.74,51.181,0,0,0,0,0,-0.0005,0; Symbol: 0805W8F5101T5E; Device: 0805W8F5101T5E; Convert to PCB: yes; Manufacturer Part: 0805W8F5101T5E; Supplier: LCSC; Supplier Part: C27834; LCSC Part Name: 厚膜电阻 5.1kΩ ±1%; Supplier Footprint: 0805; JLCPCB Part Class: Basic Part; Datasheet: https://item.szlcsc.com/datasheet/0805W8F5101T5E/28584.html; Type: Thick Film Resistor; Value: 5.1kΩ; Temperature Coefficient: ±100ppm/℃; Operating Temperature: -55℃~+155℃; FootprintName: R0805
R9 = 0805W8F1001T5E: as R2 on sheet 1_Power; Symbol: 0805W8F1001T5E; Device: 0805W8F1001T5E; Convert to PCB: yes; Manufacturer Part: 0805W8F1001T5E; Supplier: LCSC; Supplier Part: C17513; LCSC Part Name: 1kΩ ±1% 125mW 厚膜电阻; Supplier Footprint: 0805; JLCPCB Part Class: Basic Part; Datasheet: https://atta.szlcsc.com/upload/public/pdf/source/20200306/C422600_1E6D84923E4A46A82E41ADD87F860B5C.pdf; Type: Thick Film Resistors; Value: 1kΩ; Temperature Coefficient: ±100ppm/℃; Operating Temperature Range: -55℃~+155℃; FootprintName: R0805
R10 = 0805W8F1000T5E_C17408: Type:Thick Film Resistors Resistance: Tolerance:±1% Tolerance:±1% Power(Watts): Overload Voltage (Max): Temperature Coefficient:±100ppm/℃ Temperature Coefficient:±100ppm/℃ Operating Temperature Range:-55℃~+155℃ Operating Temperature Range:-55℃~+155℃; Manufacturer: UNI-ROYAL(厚声); Add into BOM: yes; PCB Layer: Default; Tolerance: ±1%; ModelId: b83c7c5430874b8eb2319a65d9433429|0819f05c4eef4c71ace90d822a990e87; ModelName: R0805_L2.0-W1.3-H0.6; ModelTransform: 78.74,51.181,0,0,0,0,0,-0.0005,0; Symbol: 0805W8F1000T5E; Device: 0805W8F1000T5E_C17408; Convert to PCB: yes; Manufacturer Part: 0805W8F1000T5E; Supplier: LCSC; Supplier Part: C17408; LCSC Part Name: 100Ω ±1% 125mW 厚膜电阻; Supplier Footprint: 0805; JLCPCB Part Class: Basic Part; Datasheet: https://atta.szlcsc.com/upload/public/pdf/source/20200306/C422600_1E6D84923E4A46A82E41ADD87F860B5C.pdf; Type: Thick Film Resistors; Value: 100Ω; Temperature Coefficient: ±100ppm/℃; Operating Temperature Range: -55℃~+155℃; FootprintName: R0805
R11 = 0805W8F1003T5E (SMT业务专用): as R3 on sheet 1_Power; Symbol: 0805W8F1003T5E; Device: 0805W8F1003T5E (SMT业务专用); Convert to PCB: yes; Manufacturer Part: 0805W8F1003T5E (SMT业务专用); Supplier: LCSC; Supplier Part: C17407; LCSC Part Name: 100kΩ ±1%; Supplier Footprint: 0805; JLCPCB Part Class: Extended Part; Datasheet: https://atta.szlcsc.com/upload/public/pdf/source/20200102/C423413_58AC64FF5730584578C10BF0002471B1.pdf; Value: 100kΩ; Power(Watts): -; Overload Voltage (Max): -; FootprintName: R0805
R12 R13 = 0805W8F4701T5E: Type:Thick Film Resistors Resistance:4.7kΩ Tolerance:±1% Tolerance:±1% Power(Watts): Overload Voltage (Max): Temperature Coefficient:±100ppm/℃ Temperature Coefficient:±100ppm/℃ Operating Temperature Range:-55℃~+155℃ Operating Temperature Range:-55℃~+155℃; Manufacturer: UNI-ROYAL(厚声); Add into BOM: yes; PCB Layer: Default; Tolerance: ±1%; ModelId: b83c7c5430874b8eb2319a65d9433429|0819f05c4eef4c71ace90d822a990e87; ModelName: R0805_L2.0-W1.3-H0.6; ModelTransform: 78.74,51.181,0,0,0,0,0,-0.0005,0; Symbol: 0805W8F4701T5E; Device: 0805W8F4701T5E; Convert to PCB: yes; Manufacturer Part: 0805W8F4701T5E; Supplier: LCSC; Supplier Part: C17673; LCSC Part Name: 4.7kΩ ±1% 125mW 厚膜电阻; Supplier Footprint: 0805; JLCPCB Part Class: Basic Part; Datasheet: https://atta.szlcsc.com/upload/public/pdf/source/20200306/C422600_1E6D84923E4A46A82E41ADD87F860B5C.pdf; Type: Thick Film Resistors; Value: 4.7kΩ; Temperature Coefficient: ±100ppm/℃; Operating Temperature Range: -55℃~+155℃; FootprintName: R0805
SW1 SW2 = TS-1187A-B-A-B: Circuit:SPST Actuator Style:Round Button Operating Force:1.6N Mounting Type:Surface Mount,Vertical Length:5.1mm Width:5.1mm Switch Height:1.5mm with Bracket:Without Bracket Contact Current:50mA Voltage Rating:12V Actuator/Cap Color:Gold With Lamp:No Life:; Manufacturer: XKB Connection(中国星坤); Add into BOM: yes; PCB Layer: Default; Circuit: SPST; Operating Force: 1.6N; Switch Height: 1.5mm; Contact Current: 50mA; Voltage Rating: 12V; Actuator/Cap Color: Gold; With Lamp: No; Life: 100,000 cycles; ModelId: 297e93217c8a461096f3cf9cc3d4db3d|0819f05c4eef4c71ace90d822a990e87; ModelTransform: 255.905,204.76337,0,0,0,0,0,0,0; Symbol: TS-1187A-B-A-B; Device: TS-1187A-B-A-B; Convert to PCB: yes; Manufacturer Part: TS-1187A-B-A-B; Supplier: LCSC; Supplier Part: C318884; LCSC Part Name: 5.1*5.1*1.5mm 立贴 轻触开关; Supplier Footprint: SMD-4P,5.1x5.1mm; JLCPCB Part Class: Basic Part; Datasheet: https://item.szlcsc.com/datasheet/TS-1187A-B-A-B/299976.html; Actuator Style: Round Button; Mounting Type: Surface Mount,Vertical; Length: 5.1mm; Width: 5.1mm; with Bracket: Without Bracket; Operating Temperature: -30℃~+85℃; FootprintName: SW-SMD_4P-L5.1-W5.1-P3.70-LS6.5-TL_H1.5; ModelName: SW-SMD_4P-L5.1-W5.1-P3.70-LS6.5-TL_H1.5
U1 = ESP32-S3-WROOM-1-N8: Utilized IC / Part:ESP32-S3 Chip Wireless Standard:Bluetooth5.0 Interface Type:SPI；I2S；USB；I2C；UART Frequency:2.4GHz Antenna Type:On-board PCB Antenna Output Power:20.5dBm Output Power:20.5dBm Voltage - Supply:3V~3.6V Voltage - Supply:3V~3.6V Receive  Cur; Manufacturer: ESPRESSIF(乐鑫); Add into BOM: yes; PCB Layer: Default; Receive  Current: 95mA; Send  Current: 355mA; Sensitivity: -98.2dBm; ModelId: 2ad47579e90e49a3ad8b3736302063ed|0819f05c4eef4c71ace90d822a990e87; ModelTransform: 708.66,1003.935,0,0,0,0,0,145.669,0; Symbol: ESP32-S3-WROOM-1-N8; Device: ESP32-S3-WROOM-1-N8; Convert to PCB: yes; Manufacturer Part: ESP32-S3-WROOM-1-N8; Supplier: LCSC; Supplier Part: C2913198; LCSC Part Name: 不带固件 不带固件 通用型Wi-Fi+低功耗蓝牙MCU模组; Supplier Footprint: SMD,25.5x18mm; JLCPCB Part Class: Extended Part; Datasheet: https://item.szlcsc.com/datasheet/ESP32-S3-WROOM-1-N8/3198296.html; Utilized IC / Part: ESP32-S3 Chip; Wireless Standard: Bluetooth5.0; Interface Type: SPI；I2S；USB；I2C；UART; Value: 2.4GHz; Antenna Type: On-board PCB Antenna; Output Power: 20.5dBm; Voltage - Supply: 3V~3.6V; Operating Temperature: -40℃~+85℃; FootprintName: WIFIM-SMD_ESP32-S3-WROOM-1-N8; ModelName: WIFIM-SMD_ESP32-S3-WROOM-1-N8
U4 = USBLC6-2SC6_C7519: Polarity:Unidirectional Reverse Stand-Off Voltage (Vrwm):5.25V Clamping Voltage:17V Peak Pulse Current (Ipp):5A Voltage - Breakdown:6V Reverse Leakage Current (Ir):150nA Number of Channels:2 Operating Temperature:-40℃~+125℃ Operating Temperature:-40℃~+125; Manufacturer: ST(意法半导体); Add into BOM: yes; PCB Layer: Default; Reverse Stand-Off Voltage (Vrwm): 5.25V; Clamping Voltage: 17V; Peak Pulse Current (Ipp): 5A; Voltage - Breakdown: 6V; Reverse Leakage Current (Ir): 150nA; Number of Channels: 2; level of protection: IEC 61000-4-2; Junction Capacitance: 3.5pF; ModelId: 1370be37a17e44418ae52e2b4cc1f5e5|0819f05c4eef4c71ace90d822a990e87; ModelName: SOT-23-6_L2.9-W1.6-H1.5-LS2.8-P0.95; ModelTransform: 110.236,113.364,0,90,0,0,0.0005,0.0005,0; Symbol: USBLC6-2SC6; Device: USBLC6-2SC6_C7519; Convert to PCB: yes; Manufacturer Part: USBLC6-2SC6; Supplier: LCSC; Supplier Part: C7519; LCSC Part Name: 单向ESD 5.25V截止 峰值脉冲电流：5A; Supplier Footprint: SOT-23-6L; JLCPCB Part Class: Extended Part; Datasheet: https://item.szlcsc.com/datasheet/USBLC6-2SC6/7996.html; Polarity: Unidirectional; Operating Temperature: -40℃~+125℃; Type: ESD; FootprintName: SOT-23-6_L2.9-W1.6-P0.95-LS2.8-BL

## Sheet 3_Sensors.schdoc
size 297 x 209 mm; Symbol: Drawing-Symbol_A4; Device: Drawing-Symbol_A4; @Project Name: Irrigation Controller v2; @Page Count: 5; @Update Date: 2026-11-21; @Create Date: 2026-11-21; @Schematic Name: Schematic1; @Page No: 3; @Page Name: 3_Sensors; Company: EasyEDA.com; Version: V1.0; Page Size: A4; @Create Time: 17:28:44; @Update Time: 17:28:44; Border: 1; Width: 1170; Height: 825; Region Start: 1; X Region Count: 6; Y Region Count: 4; Blade Width: 10; Title Block Position: 3; @Board Name: Board1
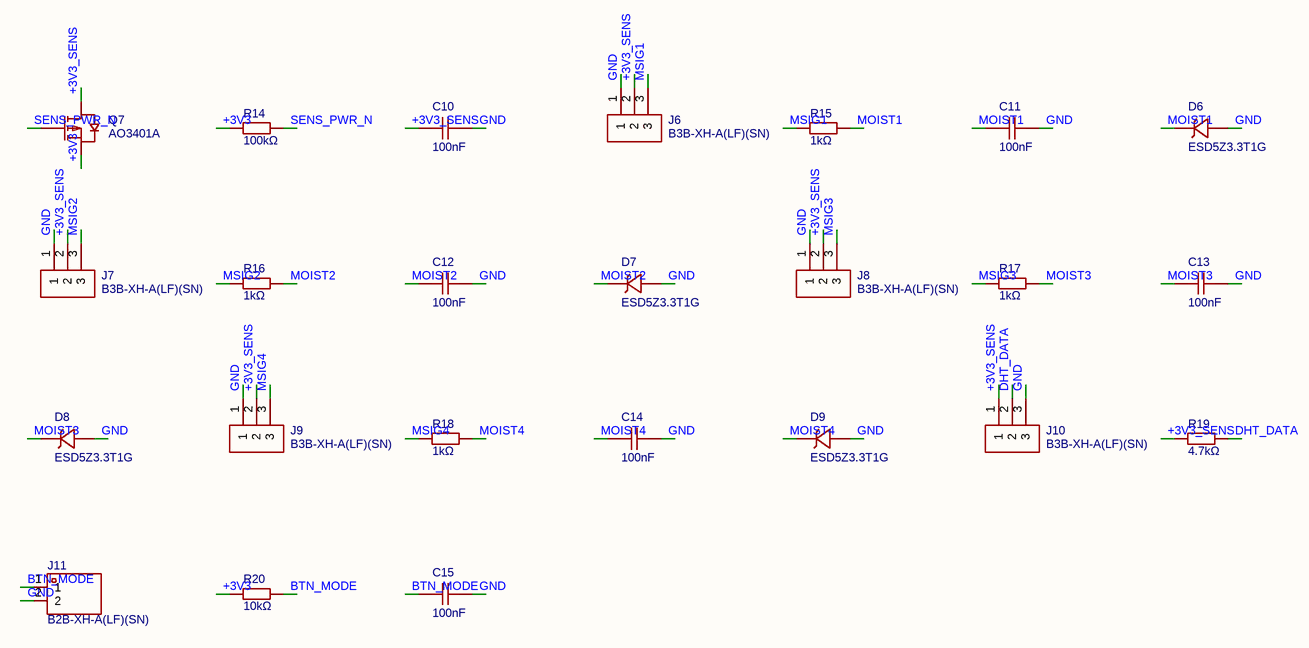
[diagram p2: 3_Sensors.schdoc]

### Parts
C10  100nF  [C0805]
C11  100nF  [C0805]
C12  100nF  [C0805]
C13  100nF  [C0805]
C14  100nF  [C0805]
C15  100nF  [C0805]
D6  ESD5Z3.3T1G  [SOD-523_L1.2-W0.8-LS1.6-FD]
D7  ESD5Z3.3T1G  [SOD-523_L1.2-W0.8-LS1.6-FD]
D8  ESD5Z3.3T1G  [SOD-523_L1.2-W0.8-LS1.6-FD]
D9  ESD5Z3.3T1G  [SOD-523_L1.2-W0.8-LS1.6-FD]
J6  B3B-XH-A(LF)(SN)  [CONN-TH_3P-P2.50_A2501WV2-3P]
J7  B3B-XH-A(LF)(SN)  [CONN-TH_3P-P2.50_A2501WV2-3P]
J8  B3B-XH-A(LF)(SN)  [CONN-TH_3P-P2.50_A2501WV2-3P]
J9  B3B-XH-A(LF)(SN)  [CONN-TH_3P-P2.50_A2501WV2-3P]
J10  B3B-XH-A(LF)(SN)  [CONN-TH_3P-P2.50_A2501WV2-3P]
J11  B2B-XH-A(LF)(SN)  [CONN-TH_B2B-XH-A-LF-SN]
Q7  AO3401A  [SOT-23_L2.9-W1.3-P1.90-LS2.4-BR]
R14  100kΩ  [R0805]
R15  1kΩ  [R0805]
R16  1kΩ  [R0805]
R17  1kΩ  [R0805]
R18  1kΩ  [R0805]
R19  4.7kΩ  [R0805]
R20  10kΩ  [R0805]

### Nets
+3V3: Q7.2(S) R14.1 R20.1
+3V3_SENS: C10.1 J6.2 J7.2 J8.2 J9.2 J10.1 Q7.3(D) R19.1
BTN_MODE: C15.1 J11.1 R20.2
DHT_DATA: J10.2 R19.2
GND: C10.2 C11.2 C12.2 C13.2 C14.2 C15.2 D6.1(A) D7.1(A) D8.1(A) D9.1(A) J6.1 J7.1 J8.1 J9.1 J10.3 J11.2
MOIST1: C11.1 D6.2(K) R15.2
MOIST2: C12.1 D7.2(K) R16.2
MOIST3: C13.1 D8.2(K) R17.2
MOIST4: C14.1 D9.2(K) R18.2
MSIG1: J6.3 R15.1
MSIG2: J7.3 R16.1
MSIG3: J8.3 R17.1
MSIG4: J9.3 R18.1
SENS_PWR_N: Q7.1(G) R14.2

### Notes on the sheet
- Create at
- 2026-11-21
- Schematic
- Board
- Schematic1
- Board1
- Update at
- Page
- 3_Sensors
- Drawn
- Reviewed
- Irrigation Controller v2
- Version
- V1.0
- Size
- A4
- Page  3  Total  5
- EasyEDA.com

### Library data of the parts
C10-C15 = CC0805KRX7R9BB104: as C6 on sheet 1_Power; Symbol: CC0805KRX7R9BB104; Device: CC0805KRX7R9BB104; Convert to PCB: yes; Manufacturer Part: CC0805KRX7R9BB104; Supplier: LCSC; Supplier Part: C49678; LCSC Part Name: 100nF ±10% 50V; Supplier Footprint: 0805; JLCPCB Part Class: Basic Part; Datasheet: https://item.szlcsc.com/datasheet/CC0805KRX7R9BB104/50686.html; Value: 100nF; FootprintName: C0805
D6-D9 = ESD5Z3.3T1G: Polarity:Unidirectional Reverse Stand-Off Voltage (Vrwm):3.3V Clamping Voltage:14V Peak Pulse Current (Ipp):11A Peak Pulse Power Dissipation (Ppp):150W Voltage - Breakdown:5V Reverse Leakage Current (Ir):200nA Number of Channels:1 Operating Temperature:-5; Manufacturer: TECH PUBLIC(台舟); Symbol: ESD5Z3.3T1G_C2827729; Add into BOM: yes; PCB Layer: Default; Reverse Stand-Off Voltage (Vrwm): 3.3V; Clamping Voltage: 14V; Peak Pulse Current (Ipp): 11A; Peak Pulse Power Dissipation (Ppp): 150W; Voltage - Breakdown: 5V; Reverse Leakage Current (Ir): 200nA; Number of Channels: 1; level of protection: IEC 61000-4-2；IEC 61000-4-4; Type: ESD; Junction Capacitance: 110pF; ModelId: c9cd6b3de4464affa41bb10afbd29ee3|0819f05c4eef4c71ace90d822a990e87; ModelName: SOD-523_L1.2-W0.8-H0.7-LS1.6; ModelTransform: 62.992,31.496,0,0,0,0,0,0,0; Device: ESD5Z3.3T1G; Convert to PCB: yes; Manufacturer Part: ESD5Z3.3T1G; Supplier: LCSC; Supplier Part: C2827729; LCSC Part Name: 单向ESD 3.3V截止 峰值浪涌电流：11A; Supplier Footprint: SOD-523; JLCPCB Part Class: Extended Part; Datasheet: https://item.szlcsc.com/datasheet/ESD5Z3.3T1G/2973411.html; Polarity: Unidirectional; Operating Temperature: -55℃~+125℃; FootprintName: SOD-523_L1.2-W0.8-LS1.6-FD
J6-J10 = B3B-XH-A(LF)(SN): Pins Structure:1x3P Pitch:2.5mm Mounting Type:Through Hole Reference Series:XH Number of Pins:3P Number of Rows:1 Number of PINs Per Row:3 Row Spacing:- Current Rating:3A Contact Material:Brass Contact Plating:Tin Operating Temperature:-25℃~+85℃ Operating; Manufacturer: JST; Add into BOM: yes; PCB Layer: Default; Pins Structure: 1x3P; Pitch: 2.5mm; Reference Series: XH; Number of PINs Per Row: 3; Current Rating: 3A; Voltage Rating: 250V; Plastic Material: PA66; Flame Retardant Rating: UL94V-0; Supplementary Features: K Pin; Z-Height of the Board: 7mm; X-Length of Bottom Edge on Board (Spacing Line): 9.9mm; Y-Width of Bottom Edge on Board: 5.75mm; ModelId: 5bef03a823d44d6d8bbe241921219234|0819f05c4eef4c71ace90d822a990e87; ModelTransform: 393.7,226.3775,0,0,0,0,-0.005,-18.465,-125.984; Symbol: B3B-XH-A(LF)(SN); Device: B3B-XH-A(LF)(SN); Convert to PCB: yes; Manufacturer Part: B3B-XH-A(LF)(SN); Supplier: LCSC; Supplier Part: C144394; LCSC Part Name: 1x3P 间距:2.5mm 直插 系列:XH; Supplier Footprint: 插件,P=2.5mm; JLCPCB Part Class: Extended Part; Datasheet: https://item.szlcsc.com/datasheet/B3B-XH-A(LF)(SN)/155726.html; Mounting Type: Through Hole; Number of Pins: 3P; Number of Rows: 1; Row Spacing: -; Contact Material: Brass; Contact Plating: Tin; Operating Temperature: -25℃~+85℃; Color: White; FootprintName: CONN-TH_3P-P2.50_A2501WV2-3P; ModelName: CONN-TH_3P-P2.50_A2501WV2-3P
J11 = B2B-XH-A(LF)(SN): Pins Structure:1x2P Pitch:2.5mm Mounting Type:Through Hole Reference Series:XH Number of Pins:2P Number of Rows:1 Number of PINs Per Row:2 Row Spacing:- Current Rating:3A Contact Material:Brass Contact Plating:Tin Operating Temperature:-25℃~+85℃ Operating; Manufacturer: JST; Add into BOM: yes; PCB Layer: Default; Pins Structure: 1x2P; Pitch: 2.5mm; Reference Series: XH; Number of PINs Per Row: 2; Current Rating: 3A; Voltage Rating: 250V; Plastic Material: PA66; Flame Retardant Rating: UL94V-0; Supplementary Features: K Pin; Z-Height of the Board: 7mm; X-Length of Bottom Edge on Board (Spacing Line): 7.4mm; Y-Width of Bottom Edge on Board: 5.75mm; ModelId: 73bce96024a747fb8562b6dd7d26ab0a|0819f05c4eef4c71ace90d822a990e87; ModelName: XH2.5-2A; ModelTransform: 295.275,224.44837,0,180,0,0,0,18.701,-98.425; Symbol: B2B-XH-A (LF)(SN); Device: B2B-XH-A(LF)(SN); Convert to PCB: yes; Manufacturer Part: B2B-XH-A(LF)(SN); Supplier: LCSC; Supplier Part: C158012; LCSC Part Name: 1x2P 间距:2.5mm 直插 系列:XH; Supplier Footprint: 插件,P=2.5mm; JLCPCB Part Class: Extended Part; Datasheet: https://item.szlcsc.com/datasheet/B2B-XH-A(LF)(SN)/169360.html; Mounting Type: Through Hole; Number of Pins: 2P; Number of Rows: 1; Row Spacing: -; Contact Material: Brass; Contact Plating: Tin; Operating Temperature: -25℃~+85℃; Color: White; FootprintName: CONN-TH_B2B-XH-A-LF-SN
Q7 = AO3401A_C15127: Number:1 P-Channel Drain to Source Voltage:30V Current - Continuous Drain(Id):4A RDS(on):47mΩ@10V；85mΩ@2.5V；60mΩ@4.5V Pd - Power Dissipation:- Gate Threshold Voltage (Vgs(th)):900mV Gate Charge(Qg):14nC@10V Input Capacitance(Ciss):645pF Reverse Transfer C; Manufacturer: AOS; Add into BOM: yes; PCB Layer: Default; Drain to Source Voltage: 30V; Current - Continuous Drain(Id): 4A; Gate Threshold Voltage (Vgs(th)): 900mV; Input Capacitance(Ciss): 645pF; Reverse Transfer Capacitance (Crss@Vds): 55pF; Output Capacitance(Coss): 80pF; ModelId: 62a57c6760504a01965db6419a6d07df|0819f05c4eef4c71ace90d822a990e87; ModelName: SOT-23-3P_L2.9-W1.3-H1.0-LS2.4-P0.95; ModelTransform: 98.64468,114.173,0,180,0,0,0.001,-0.002,0; Symbol: AO3401A; Device: AO3401A_C15127; Convert to PCB: yes; Manufacturer Part: AO3401A; Supplier: LCSC; Supplier Part: C15127; LCSC Part Name: 1个P沟道 耐压:30V 电流:4A; Supplier Footprint: SOT-23; JLCPCB Part Class: Basic Part; Datasheet: https://item.szlcsc.com/datasheet/AO3401A/15801.html; Number: 1 P-Channel; RDS(on): 47mΩ@10V；85mΩ@2.5V；60mΩ@4.5V; Pd - Power Dissipation: -; Gate Charge(Qg): 14nC@10V; Operating Temperature: -; Type: -; FootprintName: SOT-23_L2.9-W1.3-P1.90-LS2.4-BR
R14 = 0805W8F1003T5E (SMT业务专用): as R3 on sheet 1_Power; Symbol: 0805W8F1003T5E; Device: 0805W8F1003T5E (SMT业务专用); Convert to PCB: yes; Manufacturer Part: 0805W8F1003T5E (SMT业务专用); Supplier: LCSC; Supplier Part: C17407; LCSC Part Name: 100kΩ ±1%; Supplier Footprint: 0805; JLCPCB Part Class: Extended Part; Datasheet: https://atta.szlcsc.com/upload/public/pdf/source/20200102/C423413_58AC64FF5730584578C10BF0002471B1.pdf; Value: 100kΩ; Power(Watts): -; Overload Voltage (Max): -; FootprintName: R0805
R15-R18 = 0805W8F1001T5E: as R2 on sheet 1_Power; Symbol: 0805W8F1001T5E; Device: 0805W8F1001T5E; Convert to PCB: yes; Manufacturer Part: 0805W8F1001T5E; Supplier: LCSC; Supplier Part: C17513; LCSC Part Name: 1kΩ ±1% 125mW 厚膜电阻; Supplier Footprint: 0805; JLCPCB Part Class: Basic Part; Datasheet: https://atta.szlcsc.com/upload/public/pdf/source/20200306/C422600_1E6D84923E4A46A82E41ADD87F860B5C.pdf; Type: Thick Film Resistors; Value: 1kΩ; Temperature Coefficient: ±100ppm/℃; Operating Temperature Range: -55℃~+155℃; FootprintName: R0805
R19 = 0805W8F4701T5E: as R12 on sheet 2_MCU; Symbol: 0805W8F4701T5E; Device: 0805W8F4701T5E; Convert to PCB: yes; Manufacturer Part: 0805W8F4701T5E; Supplier: LCSC; Supplier Part: C17673; LCSC Part Name: 4.7kΩ ±1% 125mW 厚膜电阻; Supplier Footprint: 0805; JLCPCB Part Class: Basic Part; Datasheet: https://atta.szlcsc.com/upload/public/pdf/source/20200306/C422600_1E6D84923E4A46A82E41ADD87F860B5C.pdf; Type: Thick Film Resistors; Value: 4.7kΩ; Temperature Coefficient: ±100ppm/℃; Operating Temperature Range: -55℃~+155℃; FootprintName: R0805
R20 = 0805W8F1002T5E: as R1 on sheet 1_Power; Symbol: 0805W8F1002T5E; Device: 0805W8F1002T5E; Convert to PCB: yes; Manufacturer Part: 0805W8F1002T5E; Supplier: LCSC; Supplier Part: C17414; LCSC Part Name: 厚膜电阻 10kΩ ±1%; Supplier Footprint: 0805; JLCPCB Part Class: Basic Part; Datasheet: https://item.szlcsc.com/datasheet/0805W8F1002T5E/18102.html; Type: Thick Film Resistor; Value: 10kΩ; Temperature Coefficient: ±100ppm/℃; Operating Temperature: -55℃~+155℃; FootprintName: R0805